# Altium project ESP32IOTProduct.PrjPcb (part 4 of 6)

## Sheet Controller_Sheet.SchDoc
size A4; DocumentNumber: 3; SheetNumber: 3; SheetTotal: 10
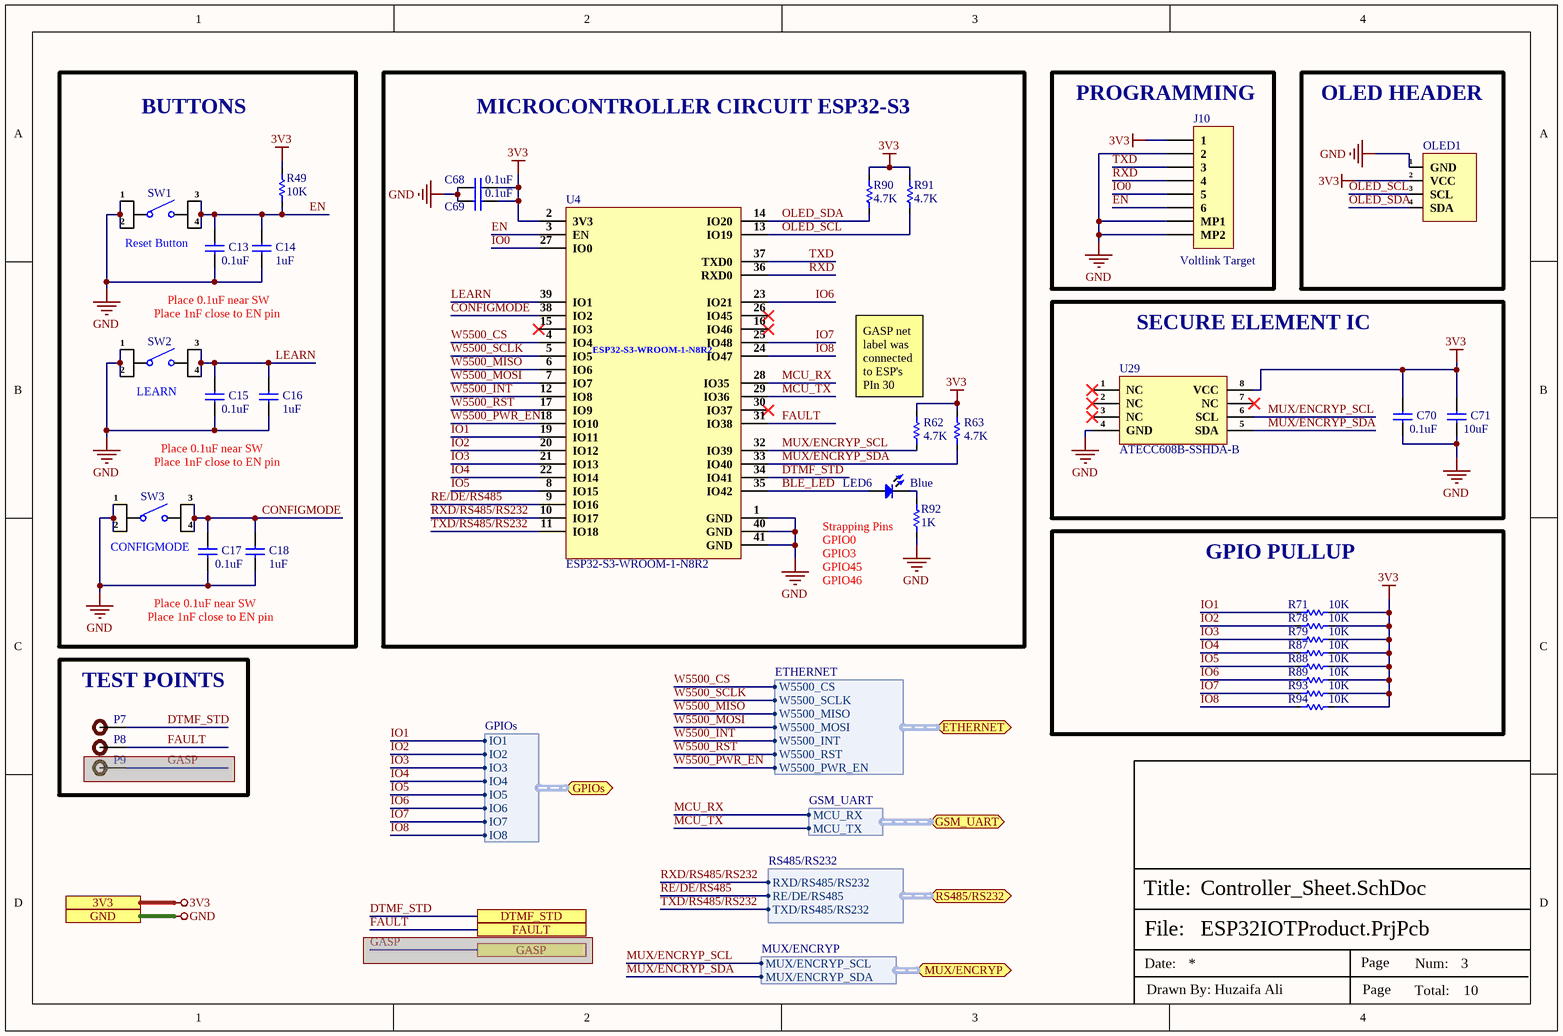
[diagram p5: Controller_Sheet.SchDoc]

### Parts
C13  0.1uF  [Cap-0603]
C14  1uF  [Cap-0603]
C15  0.1uF  [Cap-0603]
C16  1uF  [Cap-0603]
C17  0.1uF  [Cap-0603]
C18  1uF  [Cap-0603]
C68  0.1uF  [Cap-0603]
C69  0.1uF  [Cap-0603]
C70  0.1uF  [Cap-0603]
C71  10uF  [Cap-0603]
J10  Voltlink Target  [Voltlink Target]
LED6  Blue  [LED-0603]
OLED1  OLED 0.96" inch i2C  [OLED 0.96" inch i2C]  (value not drawn)
P7  TEST POINT  [Test-point]  (value not drawn)
P8  TEST POINT  [Test-point]  (value not drawn)
P9  TEST POINT  [Test-point]  (value not drawn)  (masked out: inside a compile mask, not in the netlist)
R49  10K  [Res-0603]
R62  4.7K  [Res-0603]
R63  4.7K  [Res-0603]
R71  10K  [Res-0603]
R78  10K  [Res-0603]
R79  10K  [Res-0603]
R87  10K  [Res-0603]
R88  10K  [Res-0603]
R89  10K  [Res-0603]
R90  4.7K  [Res-0603]
R91  4.7K  [Res-0603]
R92  1K  [Res-0603]
R93  10K  [Res-0603]
R94  10K  [Res-0603]
SW1  K2-6639SP-C4SC-04  [K2-6639SP-C4SC-04]  (value not drawn)
SW2  K2-6639SP-C4SC-04  [K2-6639SP-C4SC-04]  (value not drawn)
SW3  K2-6639SP-C4SC-04  [K2-6639SP-C4SC-04]  (value not drawn)
U4  ESP32-S3-WROOM-1-N8R2  [41-SMD Module]
U29  ATECC608B-SSHDA-B  [SOIC-8]

### Blocks framed on the sheet
BUTTONS: C13-C18 R49 SW1-SW3
MICROCONTROLLER CIRCUIT ESP32-S3: C68 C69 LED6 R62 R63 R90-R92 U4
PROGRAMMING: J10
OLED HEADER: OLED1
SECURE ELEMENT IC: C70 C71 U29
GPIO PULLUP: R71 R78 R79 R87-R89 R93 R94
TEST POINTS: P7-P9

### Ports
3V3, DTMF_STD, ETHERNET (bidir, harness ETHERNET), FAULT, GASP, GND, GPIOs (bidir, harness GPIOs), GSM_UART (bidir, harness GSM_UART), MUX/ENCRYP (bidir, harness MUX/ENCRYP), RS485/RS232 (bidir, harness RS485/RS232)

### Harnesses
ETHERNET: W5500_CS, W5500_SCLK, W5500_MISO, W5500_MOSI, W5500_PWR_EN, W5500_INT, W5500_RST
GSM_UART: MCU_RX, MCU_TX
RS485/RS232: RXD/RS485/RS232, RE/DE/RS485, TXD/RS485/RS232
MUX/ENCRYP: MUX/ENCRYP_SCL, MUX/ENCRYP_SDA
GPIOs: IO1, IO2, IO3, IO4, IO5, IO6, IO7, IO8

### Nets
3V3: C68.1 C69.1 C70.1 C71.1 J10.1 OLED1.2(VCC) R49.2 R62.2 R63.2 R71.1 R78.1 R79.1 R87.1 R88.1 R89.1 R90.2 R91.2 R93.1 R94.1 U4.2(3V3) U29.8(VCC) ; port 3V3
GND: C13.1 C14.2 C15.1 C16.2 C17.1 C18.2 C68.2 C69.2 C70.2 C71.2 J10.2 J10.MP1 J10.MP2 OLED1.1(GND) R92.1 SW1.1 SW1.2 SW2.1 SW2.2 SW3.1 SW3.2 U4.1(GND) U4.40(GND) U4.41(GND) U29.4(GND) ; port GND
BLE_LED: LED6.1 U4.35(IO42)
CONFIGMODE: C17.2 C18.1 SW3.3 SW3.4 U4.38(IO2)
DTMF_STD: P7.1 U4.34(IO41) ; port DTMF_STD
EN: C13.2 C14.1 J10.6 R49.1 SW1.3 SW1.4 U4.3(EN)
FAULT: P8.1 U4.31(IO38) ; port FAULT
IO0: J10.5 U4.27(IO0)
IO1: R71.2 U4.19(IO11) ; port GPIOs.IO1
IO2: R78.2 U4.20(IO12) ; port GPIOs.IO2
IO3: R79.2 U4.21(IO13) ; port GPIOs.IO3
IO4: R87.2 U4.22(IO14) ; port GPIOs.IO4
IO5: R88.2 U4.8(IO15) ; port GPIOs.IO5
IO6: R89.2 U4.23(IO21) ; port GPIOs.IO6
IO7: R93.2 U4.25(IO48) ; port GPIOs.IO7
IO8: R94.2 U4.24(IO47) ; port GPIOs.IO8
LEARN: C15.2 C16.1 SW2.3 SW2.4 U4.39(IO1)
MCU_RX: U4.28(IO35) ; port GSM_UART.MCU_RX
MCU_TX: U4.29(IO36) ; port GSM_UART.MCU_TX
MUX/ENCRYP_SCL: R62.1 U4.32(IO39) U29.6(SCL) ; port MUX/ENCRYP.MUX/ENCRYP_SCL
MUX/ENCRYP_SDA: R63.1 U4.33(IO40) U29.5(SDA) ; port MUX/ENCRYP.MUX/ENCRYP_SDA
OLED_SCL: OLED1.3(SCL) R91.1 U4.13(IO19)
OLED_SDA: OLED1.4(SDA) R90.1 U4.14(IO20)
RE/DE/RS485: U4.9(IO16) ; port RS485/RS232.RE/DE/RS485
RXD: J10.4 U4.36(RXD0)
RXD/RS485/RS232: U4.10(IO17) ; port RS485/RS232.RXD/RS485/RS232
TXD: J10.3 U4.37(TXD0)
TXD/RS485/RS232: U4.11(IO18) ; port RS485/RS232.TXD/RS485/RS232
W5500_CS: U4.4(IO4) ; port ETHERNET.W5500_CS
W5500_INT: U4.12(IO8) ; port ETHERNET.W5500_INT
W5500_MISO: U4.6(IO6) ; port ETHERNET.W5500_MISO
W5500_MOSI: U4.7(IO7) ; port ETHERNET.W5500_MOSI
W5500_PWR_EN: U4.18(IO10) ; port ETHERNET.W5500_PWR_EN
W5500_RST: U4.17(IO9) ; port ETHERNET.W5500_RST
W5500_SCLK: U4.5(IO5) ; port ETHERNET.W5500_SCLK
NetLED6_2: LED6.2 R92.2

Not connected (* = marked no-connect by the designer): U4 15(IO3)* 16(IO46)* 26(IO45)* 30(IO37)*; U29 1(NC)* 2(NC)* 3(NC)* 7(NC)*

### Notes on the sheet
- Reset Button
- Place 0.1uF near SW
- (near SW2) Place 1nF close to EN pin
- LEARN
- (near R62) GASP net label was connected to ESP's PIn 30
- Place 1nF close to EN pin
- CONFIGMODE
- (near R92) Strapping Pins
  GPIO0
  GPIO3
  GPIO45
  GPIO46
- File:
- Title:
- Date:
- Page
- Num:
- Total:
- Drawn By: Huzaifa Ali

### Library data of the parts
C13 C15 C17 C68-C70 = CC0603KRX5R9BB104: CAP CER 0.1UF 50V X5R 0603; Manufacturer: Yageo; Capacitance: 100nF; Tolerance: 10%; Item Type: Capacitor; Supplier 1: Digi-Key; Manufacturer Part Number: CC0603KRX5R9BB104; RoHS: Yes; Category: Ceramic Capacitors; Stock 1: 152253; Pricing 1: 1=0.10000, 10=0.05200, 50=0.02820, 100=0.02310, 500=0.01648, 1000=0.01294 (USD); Mount: Surface Mount; Case/Package: 0603; Case Code (Imperial): 0603; Case Code (Metric): 1608; Weight: 7.1E-05oz; Min Operating Temperature: -55°C; Max Operating Temperature: 85°C; Packaging: Tape and Reel; Voltage Rating: 50V; Dielectric: X5R; Termination: SMD/SMT; Voltage Rating (DC): 50V; Package Quantity: 4000; Length: 0.063inch; Width: 0.031inch; Thickness: 0.035inch; Lead Free: Lead Free; Halogen Free: Halogen Free; ComponentLink1URL: http://www.mouser.com/ds/2/447/Yageo_UPY-GP_NP0_16V-to-50V_9-358835.pdf?src-supplier=Mouser; ComponentLink1Description: http://www.mouser.com/ds/2/447/Yageo_UPY-GP_NP0_16V-to-50V_9-358835.pdf?src-supplier=Mouser; ComponentLink2URL: https://www.yageo.com/upload/media/product/productsearch/datasheet/mlcc/UPY-GPHC_X5R_4V-to-50V_26.pdf?src-supplier=Digi-Key; ComponentLink2Description: https://www.yageo.com/upload/media/product/productsearch/datasheet/mlcc/UPY-GPHC_X5R_4V-to-50V_26.pdf?src-supplier=Digi-Key; ComponentLink3URL: http://www.yageo.com/exep/pages/download/literatures/ProductSelectionGuide%202014_Final_2.pdf?src-supplier=Digi-Key; ComponentLink3Description: http://www.yageo.com/exep/pages/download/literatures/ProductSelectionGuide%202014_Final_2.pdf?src-supplier=Digi-Key; Supplier Part Number 1: 311-4046-1-ND; LCSC Part Number: C110022
C14 C16 C18 = CC0603KRX5R8BB105: CAP CER 1UF 25V X5R 0603; Manufacturer: Yageo; Tolerance: 10%; Supplier 1: Digi-Key; Manufacturer Part Number: CC0603KRX5R8BB105; RoHS: Yes; Category: Ceramic Capacitors; Stock 1: 919939; Pricing 1: 1=0.12000, 10=0.08400, 50=0.04760, 100=0.03940, 500=0.02764, 1000=0.02288 (USD); Mount: Surface Mount; Case/Package: 0603; Number of Pins: 2; Case Code (Metric): 1608; Case Code (Imperial): 0603; Min Operating Temperature: -55°C; Max Operating Temperature: 85°C; Capacitance: 1uF; Dielectric: X5R; Package Quantity: 1; Voltage Rating: 25V; Packaging: Tape and Reel; Termination: SMD/SMT; Voltage Rating (DC): 25V; Series: CC; Construction: Flat; Length: 1.6mm; Width: 0.031inch; Height: 0.8mm; Thickness: 0.035inch; Depth: 0.8mm; Radiation Hardening: No; REACH SVHC: No SVHC; Lead Free: Lead Free; Halogen Free: Halogen Free; RoHS Compliant: Yes; ComponentLink1URL: https://datasheet.ciiva.com/176/mlccorderingcode-176785.pdf?src-supplier=Digi-Key; ComponentLink1Description: https://datasheet.ciiva.com/176/mlccorderingcode-176785.pdf?src-supplier=Digi-Key; ComponentLink2URL: https://datasheet.ciiva.com/176/mlccorderingcode-176786.pdf?src-supplier=Digi-Key; ComponentLink2Description: https://datasheet.ciiva.com/176/mlccorderingcode-176786.pdf?src-supplier=Digi-Key; ComponentLink3URL: https://datasheet.ciiva.com/176/mlccorderingcode-176787.pdf?src-supplier=Digi-Key; ComponentLink3Description: https://datasheet.ciiva.com/176/mlccorderingcode-176787.pdf?src-supplier=Digi-Key; ComponentLink4URL: https://datasheet.ciiva.com/17436/upy-gphc-x5r-4v-to-50v-12-17436952.pdf?src-supplier=Avnet+Europe; ComponentLink4Description: https://datasheet.ciiva.com/17436/upy-gphc-x5r-4v-to-50v-12-17436952.pdf?src-supplier=Avnet+Europe; ComponentLink5URL: https://datasheet.ciiva.com/7978/1525783-7978171.pdf?src-supplier=Element14; ComponentLink5Description: https://datasheet.ciiva.com/7978/1525783-7978171.pdf?src-supplier=Element14; ComponentLink6URL: https://datasheet.ciiva.com/11586/upy-gphc-x5r-4v-to-50v-12-11586318.pdf?src-supplier=Avnet; ComponentLink6Description: https://datasheet.ciiva.com/11586/upy-gphc-x5r-4v-to-50v-12-11586318.pdf?src-supplier=Avnet; Supplier Part Number 1: 311-1445-1-ND; LCSC Part Number: C14664
C71 = C1608X5R1E106M080AC: CAP CER 10UF 25V X5R 0603; Manufacturer: TDK; Dielectric Material: Ceramic; Tolerance: 20%; Supplier 1: Digi-Key; Manufacturer Part Number: C1608X5R1E106M080AC; Stock 1: 61681; Pricing 1: 1=0.96, 10=0.704, 100=0.483, 500=0.38238, 1000=0.322 (USD); Mount: Surface Mount; Case/Package: 0603; Weight: 7.1E-05oz; Case Code (Imperial): 0603; Case Code (Metric): 1608; Min Operating Temperature: -55°C; Max Operating Temperature: 85°C; Capacitance: 10uF; Packaging: Tape and Reel; Voltage Rating: 25V; Voltage Rating (DC): 25V; Termination: SMD/SMT; Package Quantity: 1; Dielectric: X5R; Composition: Ceramic; Length: 1.6mm; Height: 0.8mm; Width: 0.8mm; Thickness: 0.039inch; Depth: 0.8mm; Lead Free: Lead Free; REACH SVHC: No SVHC; Supplier Part Number 1: 445-9015-1-ND; LCSC Part Number: C2168289
J10 = C145963: 1x6P SH 1 1mm 6 SMD,P=1mm Wire To Board / Wire To Wire Connector ROHS; Manufacturer: BOOMELE; Manufacturer Part Number: C145963; Package: SMD,P=1mm; LCSC Part Number: C145963; Item Type: Connector; ComponentLink1Description: LCSC; ComponentLink1URL: https://www.lcsc.com/product-detail/Wire-To-Board-Wire-To-Wire-Connector_BOOMELE-Boom-Precision-Elec-C145963_C145963.html
LED6 = NCD0603B3: blue 0603 Light Emitting Diodes (LED) ROHS; Manufacturer: Foshan NationStar Optoelectronics; Manufacturer Part Number: NCD0603B3; Package: 0603; LCSC Part Number: C158101; Item Type: LED; ComponentLink1Description: LCSC; ComponentLink1URL: https://www.lcsc.com/product-detail/Light-Emitting-Diodes-LED_Foshan-NationStar-Optoelectronics-NCD0603B3_C158101.html
OLED1 = OLED 0.96" inch i2C: 0.96 Inch OLED SSD1306 White/Blue/Yellow 128X64 IIC I2C Serial Display Module 12864 LCD Screen Board For Arduino; Manufacturer: TENSTAR ROBOT; Item Type: OLED Module; Manufacturer Part Number: OLED 0.96" inch i2C; Package: Custom; ComponentLink1Description: Aliexpress; ComponentLink1URL: https://vi.aliexpress.com/item/32643950109.html?gatewayAdapt=glo2vnm
P7-P9 = TEST POINT: Test Point ON
R49 R71 R78 R79 R87-R89 R93 R94 = AC0603JR-0710KL: RES SMD 10K OHM 5% 1/10W 0603; Manufacturer: Yageo; Voltage Rating: 50V; Resistance: 10kR; Power Rating: 100mW; Temperature Coefficient: 100ppm/°C; Item Type: Resistor; Supplier 1: Future Electronics; Manufacturer Part Number: AC0603JR-0710KL; RoHS: Yes; Category: Chip SMD Resistors; Stock 1: 1533000; Pricing 1: 5000=0.00540 (USD); Case/Package: 0603; Case Code (Imperial): 0603; Case Code (Metric): 1608; Size Code: 0603; Min Operating Temperature: -55°C; Max Operating Temperature: 155°C; Packaging: Tape and Reel; Tolerance: 5%; Package Quantity: 1; Resistor Type: Thick Film; Termination: SMD/SMT; Number of Terminations: 2; Max Power Dissipation: 100mW; Features: Moisture Resistant,Automotive AEC-Q200,Anti-Sulfur; Series: AC; Construction: Rectangular; Length: 0.063inch; Width: 0.031inch; Height: 0.022inch; Depth: 0.8mm; Military Standard: Not; Lead Free: Lead Free; RoHS Compliant: Yes; ComponentLink1URL: https://datasheet.ciiva.com/5562/pyu-ac-51-rohs-l-2-5562553.pdf?src-supplier=Mouser; ComponentLink1Description: https://datasheet.ciiva.com/5562/pyu-ac-51-rohs-l-2-5562553.pdf?src-supplier=Mouser; Supplier Part Number 1: 1029044; LCSC Part Number: C140867
R62 R63 R90 R91 = RC0603JR-074K7L: RES SMD 4.7K OHM 5% 1/10W 0603; Manufacturer: Yageo; Resistance: 4.7kR; Temperature Coefficient: 100ppm/°C; Voltage Rating (DC): 50V; Power Rating: 100mW; Item Type: Resistor; Supplier 1: Digi-Key; Manufacturer Part Number: RC0603JR-074K7L; Stock 1: 19706643; Pricing 1: 1=0.1, 10=0.02, 100=0.0081, 1000=0.00362, 2500=0.00314 (USD); Case/Package: 0603; Number of Pins: 2; Case Code (Imperial): 0603; Case Code (Metric): 1608; Min Operating Temperature: -55°C; Max Operating Temperature: 155°C; Tolerance: 5%; Composition: Thick Film; Packaging: Tape and Reel; Voltage Rating: 50V; Termination: SMD/SMT; Military Standard: Not; Length: 1.6mm; Width: 0.8mm; Depth: 0.8mm; REACH SVHC: No SVHC; Lead Free: Lead Free; ComponentLink1URL: http://www.farnell.com/datasheets/443971.pdf?src-supplier=Element14; ComponentLink1Description: http://www.farnell.com/datasheets/443971.pdf?src-supplier=Element14; Supplier Part Number 1: 311-4.7KGRCT-ND; LCSC Part Number: C105428
R92 = RC0603FR-071KL: RES SMD 1K OHM 1% 1/10W 0603; Manufacturer: Yageo; Resistance: 1kR; Temperature Coefficient: 100ppm/°C; Power Rating: 100mW; Voltage Rating: 50V; Item type: Resistor; ComponentLink1URL: https://www.verical.com/server-webapp/html/getDatasheet?partID=409289&src-supplier=Verical; ComponentLink1Description: https://www.verical.com/server-webapp/html/getDatasheet?partID=409289&src-supplier=Verical; Supplier 1: Digi-Key; Manufacturer Part Number: RC0603FR-071KL; Stock 1: 21472395; Pricing 1: 1=0.1, 10=0.023, 100=0.0094, 1000=0.0042, 2500=0.0037 (USD); Case/Package: 0603; Contact Plating: Tin,Matte; Case Code (Imperial): 0603; Case Code (Metric): 1608; Min Operating Temperature: -55°C; Max Operating Temperature: 155°C; Tolerance: 1%; Composition: Thick Film; Packaging: Tape and Reel; Termination: SMD/SMT; Military Standard: Not; Length: 1.6mm; Height: 0.45mm; Depth: 0.8mm; Radiation Hardening: No; REACH SVHC: No SVHC; Lead Free: Lead Free; ComponentLink2URL: http://documents.rs-components.com/techlib://itc_doclist_GB.htm?stockno=5048928&src-supplier=RSComponents; ComponentLink2Description: http://documents.rs-components.com/techlib://itc_doclist_GB.htm?stockno=5048928&src-supplier=RSComponents; ComponentLink3URL: http://www.yageo.com/documents/recent/PYu-RC0603_51_RoHS_L_4.pdf?src-supplier=Avnet+Europe; ComponentLink3Description: http://www.yageo.com/documents/recent/PYu-RC0603_51_RoHS_L_4.pdf?src-supplier=Avnet+Europe; ComponentLink4URL: http://www.farnell.com/datasheets/2167052.pdf?src-supplier=Element14; ComponentLink4Description: http://www.farnell.com/datasheets/2167052.pdf?src-supplier=Element14; ComponentLink5URL: http://www.farnell.com/datasheets/1868787.pdf?src-supplier=Element14; ComponentLink5Description: http://www.farnell.com/datasheets/1868787.pdf?src-supplier=Element14; ComponentLink6URL: http://www.yageo.com/documents/recent/PYu-RC_Group_51_RoHS_L_2.pdf?src-supplier=Avnet; ComponentLink6Description: http://www.yageo.com/documents/recent/PYu-RC_Group_51_RoHS_L_2.pdf?src-supplier=Avnet; ComponentLink7URL: https://www.verical.com/server-webapp/html/getDatasheet?partID=404327&src-supplier=Verical; ComponentLink7Description: https://www.verical.com/server-webapp/html/getDatasheet?partID=404327&src-supplier=Verical; ComponentLink8URL: http://www.farnell.com/datasheets/443971.pdf?src-supplier=Element14; ComponentLink8Description: http://www.farnell.com/datasheets/443971.pdf?src-supplier=Element14; Supplier Part Number 1: 311-1.00KHRDKR-ND; LCSC Part Number: C22548
SW1-SW3 = K2-6639SP-C4SC-04: 50mA Brick nogging SPST 100MΩ 1000000 times 250gf@±30gf 12V SMD Tactile Switches ROHS; Manufacturer: Korean Hroparts Elec; Manufacturer Part Number: K2-6639SP-C4SC-04; LCSC Part Number: C83206; Package: SMD; Item Type: Tactile Switch; ComponentLink1Description: LCSC; ComponentLink1URL: https://www.lcsc.com/product-detail/Tactile-Switches_Korean-Hroparts-Elec-K2-6639SP-C4SC-04_C83206.html
U4 = ESP32-S3-WROOM-1-N8R2: SMD,18x25.5mm WiFi Modules ROHS; Manufacturer: Espressif Systems; Item Type: Module; Supplier 1: Digi-Key; Manufacturer Part Number: ESP32-S3-WROOM-1-N8R2; RoHS: No; Category: Uncategorized; Supplier Part Number 1: 1965-ESP32-S3-WROOM-1-N8R2-ND; ComponentLink1Description: LCSC; ComponentLink1URL: https://www.lcsc.com/product-detail/WiFi-Modules_Espressif-Systems-ESP32-S3-WROOM-1-N8R2_C2913204.html; LCSC Part Number: C2913204
U29 = ATECC608B-SSHDA-B: IC AUTHENTICATION CHIP 8SOIC; Manufacturer: Microchip; Supplier 1: Rs; Manufacturer Part Number: ATECC608B-SSHDA-B; RoHS: Yes; Category: Interface ICs; Stock 1: 590; Pricing 1: 20=0.758, 50=0.704, 80=0.691 (GBP); Supplier Part Number 1: 2368834P; ComponentLink1Description: LCSC; ComponentLink1URL: https://www.lcsc.com/product-detail/Security-Verification-Encryption-ICs_Microchip-Tech-ATECC608B-SSHDA-B_C5444784.html; LCSC Part Number: C5444784; Item Type: IC

## Sheet RS485_RS232_Sheet.SchDoc
size A4; DocumentNumber: 6; SheetNumber: 6; SheetTotal: 10
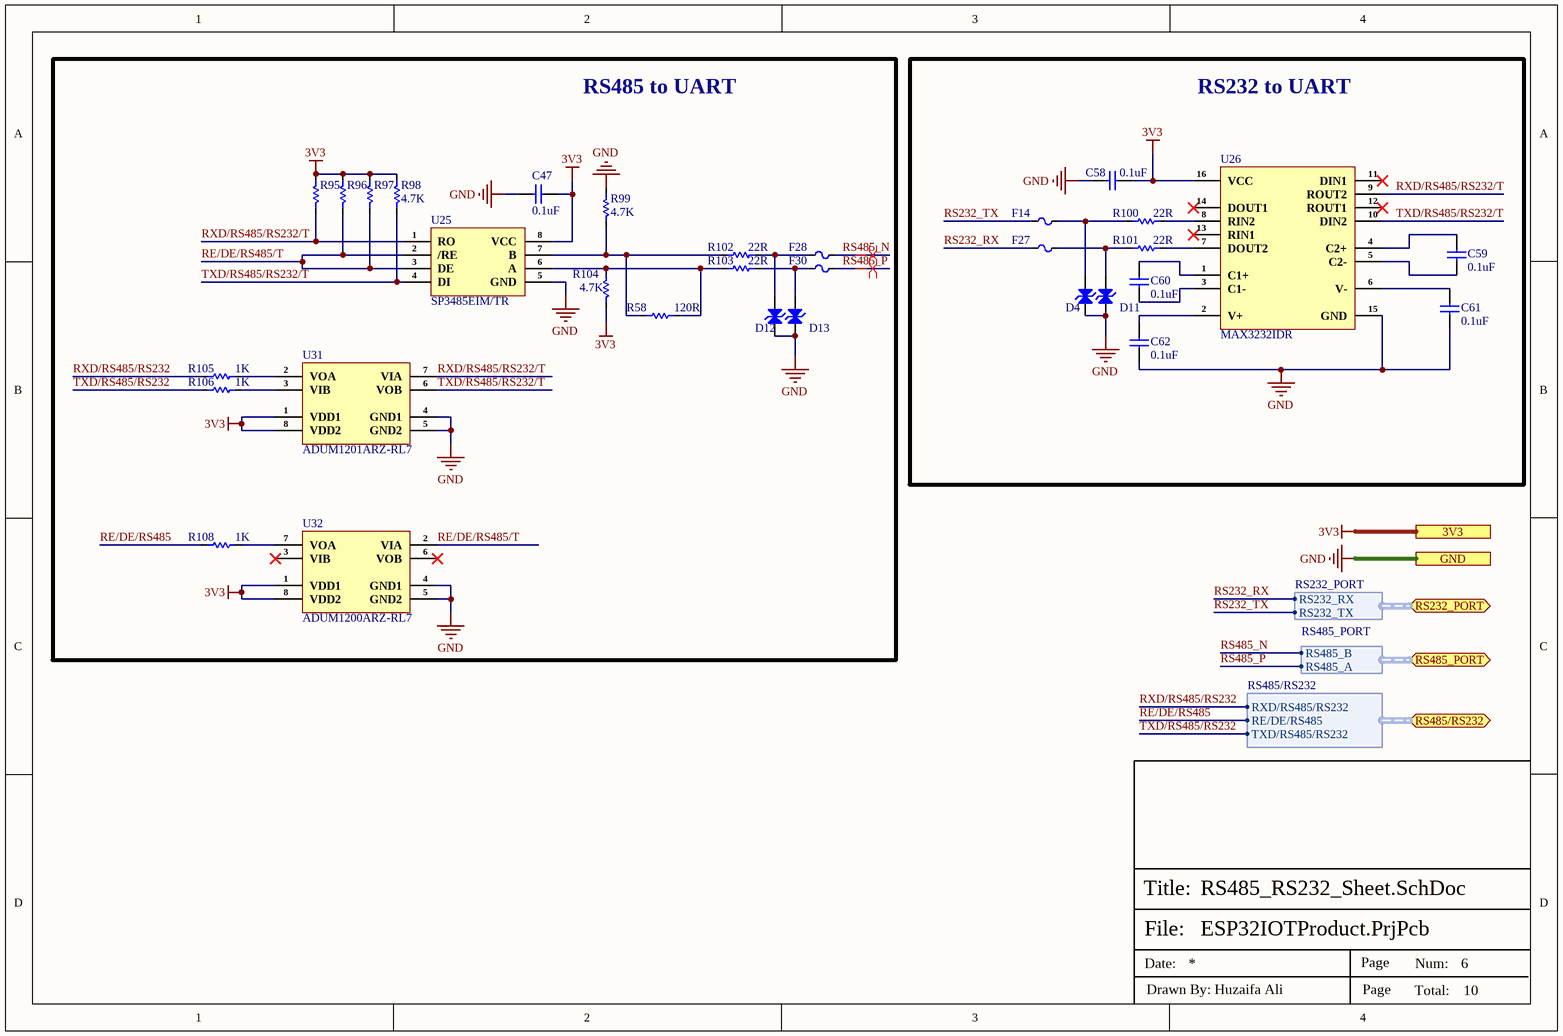
[diagram p6: RS485_RS232_Sheet.SchDoc]

### Parts
C47  0.1uF  [Cap-0603]
C58  0.1uF  [Cap-0603]
C59  0.1uF  [Cap-0603]
C60  0.1uF  [Cap-0603]
C61  0.1uF  [Cap-0603]
C62  0.1uF  [Cap-0603]
D4  SMBJ26CA  [SMB_]  (value not drawn)
D11  SMBJ26CA  [SMB_]  (value not drawn)
D12  SMBJ26CA  [SMB_]  (value not drawn)
D13  SMBJ26CA  [SMB_]  (value not drawn)
F14  SMD0805P020TF  [Fuse-0805]  (value not drawn)
F27  SMD0805P020TF  [Fuse-0805]  (value not drawn)
F28  SMD0805P020TF  [Fuse-0805]  (value not drawn)
F30  SMD0805P020TF  [Fuse-0805]  (value not drawn)
R58  120R  [Res-0603]
R95  4.7K  [Res-0603]  (value not drawn)
R96  4.7K  [Res-0603]  (value not drawn)
R97  4.7K  [Res-0603]  (value not drawn)
R98  4.7K  [Res-0603]
R99  4.7K  [Res-0603]
R100  22R  [Res-0603]
R101  22R  [Res-0603]
R102  22R  [Res-0603]
R103  22R  [Res-0603]
R104  4.7K  [Res-0603]
R105  1K  [Res-0603]
R106  1K  [Res-0603]
R108  1K  [Res-0603]
U25  SP3485EIM/TR  [SOP-8]
U26  MAX3232IDR  [SOIC-16]
U31  ADUM1201ARZ-RL7  [SOIC-8]
U32  ADUM1200ARZ-RL7  [SOIC-8]

### Blocks framed on the sheet
RS485 to UART: C47 D12 D13 F28 F30 R58 R95-R99 R102-R106 R108 U25 U31 U32
RS232 to UART: C58-C62 D4 D11 F14 F27 R100 R101 U26

### Ports
3V3, GND, RS232_PORT (bidir, harness RS232_PORT), RS485/RS232 (bidir, harness RS485/RS232), RS485_PORT (bidir, harness RS485_PORT)

### Harnesses
RS485_PORT: RS485_B, RS485_A
RS232_PORT: RS232_RX, RS232_TX
RS485/RS232: RXD/RS485/RS232, RE/DE/RS485, TXD/RS485/RS232

### Nets
3V3: C47.2 C58.2 R95.1 R96.1 R97.1 R98.1 R104.2 U25.8(VCC) U26.16(VCC) U31.1(VDD1) U31.8(VDD2) U32.1(VDD1) U32.8(VDD2) ; port 3V3
GND: C47.1 C58.1 C61.2 C62.2 D4.1(A) D11.1(A) D12.1(A) D13.1(A) R99.1 U25.5(GND) U26.15(GND) U31.4(GND1) U31.5(GND2) U32.4(GND1) U32.5(GND2) ; port GND
RE/DE/RS485: R108.2 ; port RS485/RS232.RE/DE/RS485
RE/DE/RS485/T: R96.2 R97.2 U25.2(/RE) U25.3(DE) U32.2(VIA)
RS232_RX: F27.1 ; port RS232_PORT.RS232_RX  [project net RS232_PORT.RS232_RX]
RS232_TX: F14.1 ; port RS232_PORT.RS232_TX  [project net RS232_PORT.RS232_TX]
RS485_N: F28.2 ; port RS485_PORT.RS485_B
RS485_P: F30.2 ; port RS485_PORT.RS485_A
RXD/RS485/RS232: R105.2 ; port RS485/RS232.RXD/RS485/RS232
RXD/RS485/RS232/T: R95.2 U25.1(RO) U26.9(ROUT2) U31.7(VIA)
TXD/RS485/RS232: R106.2 ; port RS485/RS232.TXD/RS485/RS232
TXD/RS485/RS232/T: R98.2 U25.4(DI) U26.10(DIN2) U31.6(VOB)
NetC59_1: C59.1 U26.4(C2+)
NetC59_2: C59.2 U26.5(C2-)
NetC60_1: C60.1 U26.1(C1+)
NetC60_2: C60.2 U26.3(C1-)
NetC61_1: C61.1 U26.6(V-)
NetC62_1: C62.1 U26.2(V+)
NetD4_2: D4.2(K) F14.2 R100.1
NetD11_2: D11.2(K) F27.2 R101.1
NetD12_2: D12.2(K) F28.1 R102.2
NetD13_2: D13.2(K) F30.1 R103.2
NetR58_1: R58.1 R99.2 R102.1 U25.7(B)
NetR58_2: R58.2 R103.1 R104.1 U25.6(A)
NetR100_2: R100.2 U26.8(RIN2)
NetR101_2: R101.2 U26.7(DOUT2)
NetR105_1: R105.1 U31.2(VOA)
NetR106_1: R106.1 U31.3(VIB)
NetR108_1: R108.1 U32.7(VOA)

Not connected (* = marked no-connect by the designer): U26 11(DIN1)* 12(ROUT1)* 13(RIN1)* 14(DOUT1)*; U32 3(VIB)* 6(VOB)*

### Layout directives
differential pair; net class RS485; differential pair class RS485_LINES; rule Impedance Constraint [Min = 115.0    Max = 120.0    ]; rule Matched Net Lengths [Tolerance = 0.508mm]: RS485_N, RS485_P

### Notes on the sheet
- File:
- Title:
- Date:
- Page
- Num:
- Total:
- Drawn By: Huzaifa Ali

### Library data of the parts
C47 C58-C62 = CC0603KRX5R9BB104: as C13 on sheet Controller_Sheet; Supplier 1: Digi-Key; Manufacturer Part Number: CC0603KRX5R9BB104; RoHS: Yes; Category: Ceramic Capacitors; Stock 1: 152253; Pricing 1: 1=0.10000, 10=0.05200, 50=0.02820, 100=0.02310, 500=0.01648, 1000=0.01294 (USD); Mount: Surface Mount; Case/Package: 0603; Case Code (Imperial): 0603; Case Code (Metric): 1608; Weight: 7.1E-05oz; Min Operating Temperature: -55°C; Max Operating Temperature: 85°C; Packaging: Tape and Reel; Voltage Rating: 50V; Dielectric: X5R; Termination: SMD/SMT; Voltage Rating (DC): 50V; Package Quantity: 4000; Length: 0.063inch; Width: 0.031inch; Thickness: 0.035inch; Lead Free: Lead Free; Halogen Free: Halogen Free; ComponentLink1URL: http://www.mouser.com/ds/2/447/Yageo_UPY-GP_NP0_16V-to-50V_9-358835.pdf?src-supplier=Mouser; ComponentLink1Description: http://www.mouser.com/ds/2/447/Yageo_UPY-GP_NP0_16V-to-50V_9-358835.pdf?src-supplier=Mouser; ComponentLink2URL: https://www.yageo.com/upload/media/product/productsearch/datasheet/mlcc/UPY-GPHC_X5R_4V-to-50V_26.pdf?src-supplier=Digi-Key; ComponentLink2Description: https://www.yageo.com/upload/media/product/productsearch/datasheet/mlcc/UPY-GPHC_X5R_4V-to-50V_26.pdf?src-supplier=Digi-Key; ComponentLink3URL: http://www.yageo.com/exep/pages/download/literatures/ProductSelectionGuide%202014_Final_2.pdf?src-supplier=Digi-Key; ComponentLink3Description: http://www.yageo.com/exep/pages/download/literatures/ProductSelectionGuide%202014_Final_2.pdf?src-supplier=Digi-Key; Supplier Part Number 1: 311-4046-1-ND; LCSC Part Number: C110022
D4 D11-D13 = SMBJ26CA: SMB(DO-214AA) TVS ROHS; Manufacturer: MSKSEMI; Item Type: Diode; Manufacturer Part Number: SMBJ26CA; Package: SMB(DO-214AA); LCSC Part Number: C5331111; ComponentLink1Description: LCSC; ComponentLink1URL: https://www.lcsc.com/product-detail/TVS_MSKSEMI-SMBJ26CA_C5331111.html
F14 F27 F28 F30 = SMD0805P020TF: 9V 200mA 100A 500mA 0805 Resettable Fuses ROHS; Manufacturer: RUILON; Item Type: Fuse; Manufacturer Part Number: SMD0805P020TF; Package: 0805; LCSC Part Number: C20976; ComponentLink1Description: LCSC; ComponentLink1URL: https://www.lcsc.com/product-detail/Resettable-Fuses_RUILON-Shenzhen-Ruilongyuan-Elec-SMD0805P020TF_C20976.html
R58 = RC0603FR-07120RL: RES 120 OHM 1% 1/10W 0603; Manufacturer: Yageo; Temperature Coefficient: 100ppm/°C; Voltage Rating (DC): 50V; Power Rating: 100mW; Supplier 1: Digi-Key; Manufacturer Part Number: RC0603FR-07120RL; RoHS: Yes; Category: Chip SMD Resistors; Stock 1: 839061; Pricing 1: 1=0.10000, 10=0.02400, 100=0.00970, 1000=0.00436, 2500=0.00378 (USD); Case/Package: 0603; Number of Pins: 2; Case Code (Metric): 1608; Case Code (Imperial): 0603; Size Code: 0603; Min Operating Temperature: -55°C; Max Operating Temperature: 155°C; Resistance: 120R; Tolerance: 1%; Resistor Type: Thick Film; Packaging: Tape and Reel; Voltage Rating: 50V; Package Quantity: 1; Number of Terminations: 2; Termination: SMD/SMT; Max Power Dissipation: 100mW; Features: Moisture Resistant; Series: RC; Construction: Rectangular; Resistance Tolerance: 1%; Length: 1.6mm; Width: 0.031inch; Height: 0.022inch; Depth: 0.8mm; REACH SVHC: No SVHC; Lead Free: Lead Free; Military Standard: Not; RoHS Compliant: Yes; ComponentLink1URL: https://datasheet.ciiva.com/2553/pyu-r-int-thick-7-2553512.pdf?src-supplier=Digi-Key; ComponentLink1Description: https://datasheet.ciiva.com/2553/pyu-r-int-thick-7-2553512.pdf?src-supplier=Digi-Key; ComponentLink2URL: https://datasheet.ciiva.com/7746/443971-7746248.pdf?src-supplier=Element14; ComponentLink2Description: https://datasheet.ciiva.com/7746/443971-7746248.pdf?src-supplier=Element14; ComponentLink3URL: https://datasheet.ciiva.com/2553/pyu-r-int-thick-7-2553513.pdf?src-supplier=Digi-Key; ComponentLink3Description: https://datasheet.ciiva.com/2553/pyu-r-int-thick-7-2553513.pdf?src-supplier=Digi-Key; ComponentLink4URL: https://datasheet.ciiva.com/7746/443971-7746249.pdf?src-supplier=Element14; ComponentLink4Description: https://datasheet.ciiva.com/7746/443971-7746249.pdf?src-supplier=Element14; ComponentLink5URL: https://datasheet.ciiva.com/2553/pyu-r-int-thick-7-2553514.pdf?src-supplier=Digi-Key; ComponentLink5Description: https://datasheet.ciiva.com/2553/pyu-r-int-thick-7-2553514.pdf?src-supplier=Digi-Key; ComponentLink6URL: https://datasheet.ciiva.com/46395/443971-46395021.pdf?src-supplier=Element14; ComponentLink6Description: https://datasheet.ciiva.com/46395/443971-46395021.pdf?src-supplier=Element14; Supplier Part Number 1: 311-120HRCT-ND; LCSC Part Number: C114640
R95-R99 R104 = RC0603JR-074K7L: as R62 on sheet Controller_Sheet; Supplier 1: Digi-Key; Manufacturer Part Number: RC0603JR-074K7L; Stock 1: 19706643; Pricing 1: 1=0.1, 10=0.02, 100=0.0081, 1000=0.00362, 2500=0.00314 (USD); Case/Package: 0603; Number of Pins: 2; Case Code (Imperial): 0603; Case Code (Metric): 1608; Min Operating Temperature: -55°C; Max Operating Temperature: 155°C; Tolerance: 5%; Composition: Thick Film; Packaging: Tape and Reel; Voltage Rating: 50V; Termination: SMD/SMT; Military Standard: Not; Length: 1.6mm; Width: 0.8mm; Depth: 0.8mm; REACH SVHC: No SVHC; Lead Free: Lead Free; ComponentLink1URL: http://www.farnell.com/datasheets/443971.pdf?src-supplier=Element14; ComponentLink1Description: http://www.farnell.com/datasheets/443971.pdf?src-supplier=Element14; Supplier Part Number 1: 311-4.7KGRCT-ND; LCSC Part Number: C105428
R100-R103 = RC0603FR-0722RL: RES 22 OHM 1% 1/10W 0603; Manufacturer: Yageo; Temperature Coefficient: 100ppm/°C; Voltage Rating (DC): 50V; Power Rating: 100mW; Item Type: Resistor; Supplier 1: Avnet; Manufacturer Part Number: RC0603FR-0722RL; RoHS: Yes; Category: Chip SMD Resistors; Stock 1: 190000; Pricing 1: 5000=0.00133, 10000=0.00131, 20000=0.00127 (USD); Case/Package: 0603; Number of Pins: 2; Case Code (Metric): 1608; Case Code (Imperial): 0603; Size Code: 0603; Min Operating Temperature: -55°C; Max Operating Temperature: 155°C; Tolerance: 1%; Resistance: 22R; Resistor Type: Thick Film; Packaging: Tape and Reel; Voltage Rating: 50V; Package Quantity: 1; Number of Terminations: 2; Termination: SMD/SMT; Max Power Dissipation: 100mW; Features: Moisture Resistant; Series: RC; Resistance Tolerance: 1%; Technology: THICK FILM; Construction: Rectangular; Length: 0.063inch; Width: 0.031inch; Height: 0.022inch; Depth: 0.8mm; Reach SVHC Compliant: Yes; Lead Free: Lead Free; Military Standard: Not; RoHS Compliant: Yes; ComponentLink1URL: https://datasheet.ciiva.com/11819/0900766b80f96399-11819285.pdf?src-supplier=RSComponents; ComponentLink1Description: https://datasheet.ciiva.com/11819/0900766b80f96399-11819285.pdf?src-supplier=RSComponents; ComponentLink2URL: https://datasheet.ciiva.com/46395/443971-46395032.pdf?src-supplier=Element14; ComponentLink2Description: https://datasheet.ciiva.com/46395/443971-46395032.pdf?src-supplier=Element14; ComponentLink3URL: https://datasheet.ciiva.com/46440/1868787-46440901.pdf?src-supplier=Element14; ComponentLink3Description: https://datasheet.ciiva.com/46440/1868787-46440901.pdf?src-supplier=Element14; ComponentLink4URL: https://datasheet.ciiva.com/2454/pyu-r-int-thick-7-2454355.pdf?src-supplier=Digi-Key; ComponentLink4Description: https://datasheet.ciiva.com/2454/pyu-r-int-thick-7-2454355.pdf?src-supplier=Digi-Key; ComponentLink5URL: https://datasheet.ciiva.com/2454/pyu-r-int-thick-7-2454356.pdf?src-supplier=Digi-Key; ComponentLink5Description: https://datasheet.ciiva.com/2454/pyu-r-int-thick-7-2454356.pdf?src-supplier=Digi-Key; ComponentLink6URL: https://datasheet.ciiva.com/2454/pyu-r-int-thick-7-2454354.pdf?src-supplier=Digi-Key; ComponentLink6Description: https://datasheet.ciiva.com/2454/pyu-r-int-thick-7-2454354.pdf?src-supplier=Digi-Key; Supplier Part Number 1: RC0603FR-0722RL; LCSC Part Number: C107701
R105 R106 R108 = RC0603FR-071KL: as R92 on sheet Controller_Sheet; ComponentLink1URL: https://www.verical.com/server-webapp/html/getDatasheet?partID=409289&src-supplier=Verical; ComponentLink1Description: https://www.verical.com/server-webapp/html/getDatasheet?partID=409289&src-supplier=Verical; Supplier 1: Digi-Key; Manufacturer Part Number: RC0603FR-071KL; Stock 1: 21472395; Pricing 1: 1=0.1, 10=0.023, 100=0.0094, 1000=0.0042, 2500=0.0037 (USD); Case/Package: 0603; Contact Plating: Tin,Matte; Case Code (Imperial): 0603; Case Code (Metric): 1608; Min Operating Temperature: -55°C; Max Operating Temperature: 155°C; Tolerance: 1%; Composition: Thick Film; Packaging: Tape and Reel; Termination: SMD/SMT; Military Standard: Not; Length: 1.6mm; Height: 0.45mm; Depth: 0.8mm; Radiation Hardening: No; REACH SVHC: No SVHC; Lead Free: Lead Free; ComponentLink2URL: http://documents.rs-components.com/techlib://itc_doclist_GB.htm?stockno=5048928&src-supplier=RSComponents; ComponentLink2Description: http://documents.rs-components.com/techlib://itc_doclist_GB.htm?stockno=5048928&src-supplier=RSComponents; ComponentLink3URL: http://www.yageo.com/documents/recent/PYu-RC0603_51_RoHS_L_4.pdf?src-supplier=Avnet+Europe; ComponentLink3Description: http://www.yageo.com/documents/recent/PYu-RC0603_51_RoHS_L_4.pdf?src-supplier=Avnet+Europe; ComponentLink4URL: http://www.farnell.com/datasheets/2167052.pdf?src-supplier=Element14; ComponentLink4Description: http://www.farnell.com/datasheets/2167052.pdf?src-supplier=Element14; ComponentLink5URL: http://www.farnell.com/datasheets/1868787.pdf?src-supplier=Element14; ComponentLink5Description: http://www.farnell.com/datasheets/1868787.pdf?src-supplier=Element14; ComponentLink6URL: http://www.yageo.com/documents/recent/PYu-RC_Group_51_RoHS_L_2.pdf?src-supplier=Avnet; ComponentLink6Description: http://www.yageo.com/documents/recent/PYu-RC_Group_51_RoHS_L_2.pdf?src-supplier=Avnet; ComponentLink7URL: https://www.verical.com/server-webapp/html/getDatasheet?partID=404327&src-supplier=Verical; ComponentLink7Description: https://www.verical.com/server-webapp/html/getDatasheet?partID=404327&src-supplier=Verical; ComponentLink8URL: http://www.farnell.com/datasheets/443971.pdf?src-supplier=Element14; ComponentLink8Description: http://www.farnell.com/datasheets/443971.pdf?src-supplier=Element14; Supplier Part Number 1: 311-1.00KHRDKR-ND; LCSC Part Number: C22548
U25 = SP3485EIM/TR: SOP-8 RS-485/RS-422 ICs ROHS; Manufacturer: HGSEMI; Item Type: IC; Manufacturer Part Number: SP3485EIM/TR; Package: SOP-8; LCSC Part Number: C519086; ComponentLink1Description: LCSC; ComponentLink1URL: https://www.lcsc.com/product-detail/RS-485-RS-422-ICs_HGSEMI-SP3485EIM-TR_C519086.html
U26 = MAX3232IDR: IC TRANSCEIVER FULL 2/2 16SOIC; Manufacturer: Texas Instruments; Min Supply Voltage: 3V; Max Supply Voltage: 5.5V; Data Rate: 250Kbps; Number of Receivers: 2; Operating Supply Voltage: 5V; Logic Function: Transceiver,Receiver; Number of Transceivers: 1; Supply Current: 1mA; Simplex/Duplex: Full Duplex; Receiver Hysteresis: 300mV; Supplier 1: Mouser; Manufacturer Part Number: MAX3232IDR; RoHS: Yes; Category: Interface ICs; Stock 1: 22181; Pricing 1: 1=2.37, 10=2.37, 50=2.37, 100=2.37, 1000=2.37, 10000=2.37 (USD); Mounting Technology: Surface Mount; Case/Package: D; Pins: 16; Weight: 0.004998oz; Min Operating Temperature: -40°C; Max Operating Temperature: 85°C; Packaging: Tape and Reel; Package Quantity: 1; Number of Transmitters: 2; Number of Drivers: 2; Series: -; Operating Supply Current: 1mA; Lead Free: Lead Free; RoHS Compliant: Yes; Reach SVHC Compliant: No; ComponentLink1URL: https://datasheet.ciiva.com/8064/1882754-8064745.pdf?src-supplier=Element14; ComponentLink1Description: https://datasheet.ciiva.com/8064/1882754-8064745.pdf?src-supplier=Element14; ComponentLink2URL: https://datasheet.ciiva.com/46394/1882754-46394523.pdf?src-supplier=Element14; ComponentLink2Description: https://datasheet.ciiva.com/46394/1882754-46394523.pdf?src-supplier=Element14; ComponentLink3URL: https://datasheet.ciiva.com/46397/1882754-46397996.pdf?src-supplier=Element14; ComponentLink3Description: https://datasheet.ciiva.com/46397/1882754-46397996.pdf?src-supplier=Element14; ComponentLink4URL: https://datasheet.ciiva.com/1701/max3232-1701626.pdf?src-supplier=Digi-Key; ComponentLink4Description: https://datasheet.ciiva.com/1701/max3232-1701626.pdf?src-supplier=Digi-Key; ComponentLink5URL: https://datasheet.ciiva.com/1701/max3232-1701625.pdf?src-supplier=Digi-Key; ComponentLink5Description: https://datasheet.ciiva.com/1701/max3232-1701625.pdf?src-supplier=Digi-Key; ComponentLink6URL: https://datasheet.ciiva.com/1701/max3232-1701627.pdf?src-supplier=Digi-Key; ComponentLink6Description: https://datasheet.ciiva.com/1701/max3232-1701627.pdf?src-supplier=Digi-Key; Supplier Part Number 1: 595-MAX3232IDR; LCSC Part Number: C18261; Item Type: IC
U31 = ADUM1201ARZ-RL7: DGTL ISO 2.5KV GEN PURP 8SOIC; Manufacturer: Analog Devices; Number of Channels: 2; Propagation Delay: 150ns; Min Supply Voltage: 2.7V; Max Supply Voltage: 5.5V; Data Rate: 25Mbps; Channel Type: Unidirectional; Polarity: Bidirectional; Operating Supply Current: 600uA; ESD Protection: No; Output Current: 35mA; Pulse Width Distortion (PWD): 40ns; Voltage: 5V; Approvals: UL,CSA,VDE; Item Type: IC; Supplier 1: Arrow Electronics; Manufacturer Part Number: ADUM1201ARZ-RL7; RoHS: Yes; Category: Interface ICs; Stock 1: 710; Pricing 1: 1=3.9521, 10=3.5429, 25=3.3533, 100=2.9042, 250=2.7545, 500=2.475, 1000=2.2037 (USD); Case/Package: R; Pins: 8; Weight: 0.019048oz; Min Operating Temperature: -40°C; Max Operating Temperature: 125°C; Packaging: Tape and Reel; Turn-On Delay Time: 150ns; Isolated Power: No; Type: General Purpose; Max Supply Current: 600uA; Series: iCoupler®; Radiation Hardening: No; Lead Free: Contains Lead; RoHS Compliant: Yes; ComponentLink1URL: https://datasheet.ciiva.com/15119/getdatasheetpartid-121048-15119389.pdf?src-supplier=Verical; ComponentLink1Description: https://datasheet.ciiva.com/15119/getdatasheetpartid-121048-15119389.pdf?src-supplier=Verical; ComponentLink2URL: https://datasheet.ciiva.com/15367/adum1200-1201-279454-15367752.pdf?src-supplier=Mouser; ComponentLink2Description: https://datasheet.ciiva.com/15367/adum1200-1201-279454-15367752.pdf?src-supplier=Mouser; ComponentLink3URL: https://datasheet.ciiva.com/3149/adum1200-1201-3149740.pdf?src-supplier=Avnet; ComponentLink3Description: https://datasheet.ciiva.com/3149/adum1200-1201-3149740.pdf?src-supplier=Avnet; ComponentLink4URL: https://datasheet.ciiva.com/3148/adum1200-1201-3148345.pdf?src-supplier=Avnet; ComponentLink4Description: https://datasheet.ciiva.com/3148/adum1200-1201-3148345.pdf?src-supplier=Avnet; ComponentLink5URL: https://datasheet.ciiva.com/2081/adum1200-1201-2081793.pdf?src-supplier=Digi-Key; ComponentLink5Description: https://datasheet.ciiva.com/2081/adum1200-1201-2081793.pdf?src-supplier=Digi-Key; ComponentLink6URL: https://datasheet.ciiva.com/2081/adum1200-1201-2081794.pdf?src-supplier=Digi-Key; ComponentLink6Description: https://datasheet.ciiva.com/2081/adum1200-1201-2081794.pdf?src-supplier=Digi-Key; ComponentLink7URL: https://datasheet.ciiva.com/2081/adum1200-1201-2081792.pdf?src-supplier=Digi-Key; ComponentLink7Description: https://datasheet.ciiva.com/2081/adum1200-1201-2081792.pdf?src-supplier=Digi-Key; Supplier Part Number 1: ADUM1201ARZ-RL7; LCSC Part Number: C9669
U32 = ADUM1200ARZ-RL7: DGTL ISO 2.5KV GEN PURP 8SOIC; Manufacturer: Analog Devices; Number of Channels: 2; Propagation Delay: 150ns; Min Supply Voltage: 2.7V; Operating Supply Voltage: 3.3V; Max Supply Voltage: 5.5V; Data Rate: 25Mbps; Channel Type: Unidirectional; Output Current: 35mA; Isolated Power: No; Pulse Width Distortion (PWD): 40ns; Supply Current: 600uA; Item Type: IC; Supplier 1: Arrow Electronics; Manufacturer Part Number: ADUM1200ARZ-RL7; RoHS: Yes; Category: Interface ICs; Stock 1: 14777; Pricing 1: 1=3.887, 10=3.493, 25=3.295, 100=2.865, 250=2.706, 500=2.425, 1000=2.066, 3000=2.048, 6000=2.025 (USD); Case/Package: R; Pins: 8; Min Operating Temperature: -40°C; Max Operating Temperature: 125°C; Packaging: Tape and Reel; Package Quantity: 1000; Turn-On Delay Time: 150ns; Type: General Purpose; Series: iCoupler®; Radiation Hardening: No; Lead Free: Contains Lead; RoHS Compliant: Yes; ComponentLink1URL: https://datasheet.ciiva.com/15119/getdatasheetpartid-258305-15119482.pdf?src-supplier=Verical; ComponentLink1Description: https://datasheet.ciiva.com/15119/getdatasheetpartid-258305-15119482.pdf?src-supplier=Verical; ComponentLink2URL: https://datasheet.ciiva.com/30514/1805054-30514023.pdf?src-supplier=Jameco; ComponentLink2Description: https://datasheet.ciiva.com/30514/1805054-30514023.pdf?src-supplier=Jameco; ComponentLink3URL: https://datasheet.ciiva.com/3148/adum1200-1201-3148342.pdf?src-supplier=Avnet; ComponentLink3Description: https://datasheet.ciiva.com/3148/adum1200-1201-3148342.pdf?src-supplier=Avnet; ComponentLink4URL: https://datasheet.ciiva.com/2081/adum1200-1201-2081796.pdf?src-supplier=Digi-Key; ComponentLink4Description: https://datasheet.ciiva.com/2081/adum1200-1201-2081796.pdf?src-supplier=Digi-Key; ComponentLink5URL: https://datasheet.ciiva.com/2081/adum1200-1201-2081797.pdf?src-supplier=Digi-Key; ComponentLink5Description: https://datasheet.ciiva.com/2081/adum1200-1201-2081797.pdf?src-supplier=Digi-Key; ComponentLink6URL: https://datasheet.ciiva.com/2081/adum1200-1201-2081795.pdf?src-supplier=Digi-Key; ComponentLink6Description: https://datasheet.ciiva.com/2081/adum1200-1201-2081795.pdf?src-supplier=Digi-Key; Supplier Part Number 1: ADUM1200ARZ-RL7; LCSC Part Number: C15219

## Sheet LEDs_Sheet.SchDoc
size A4; SheetNumber: 8; SheetTotal: 10
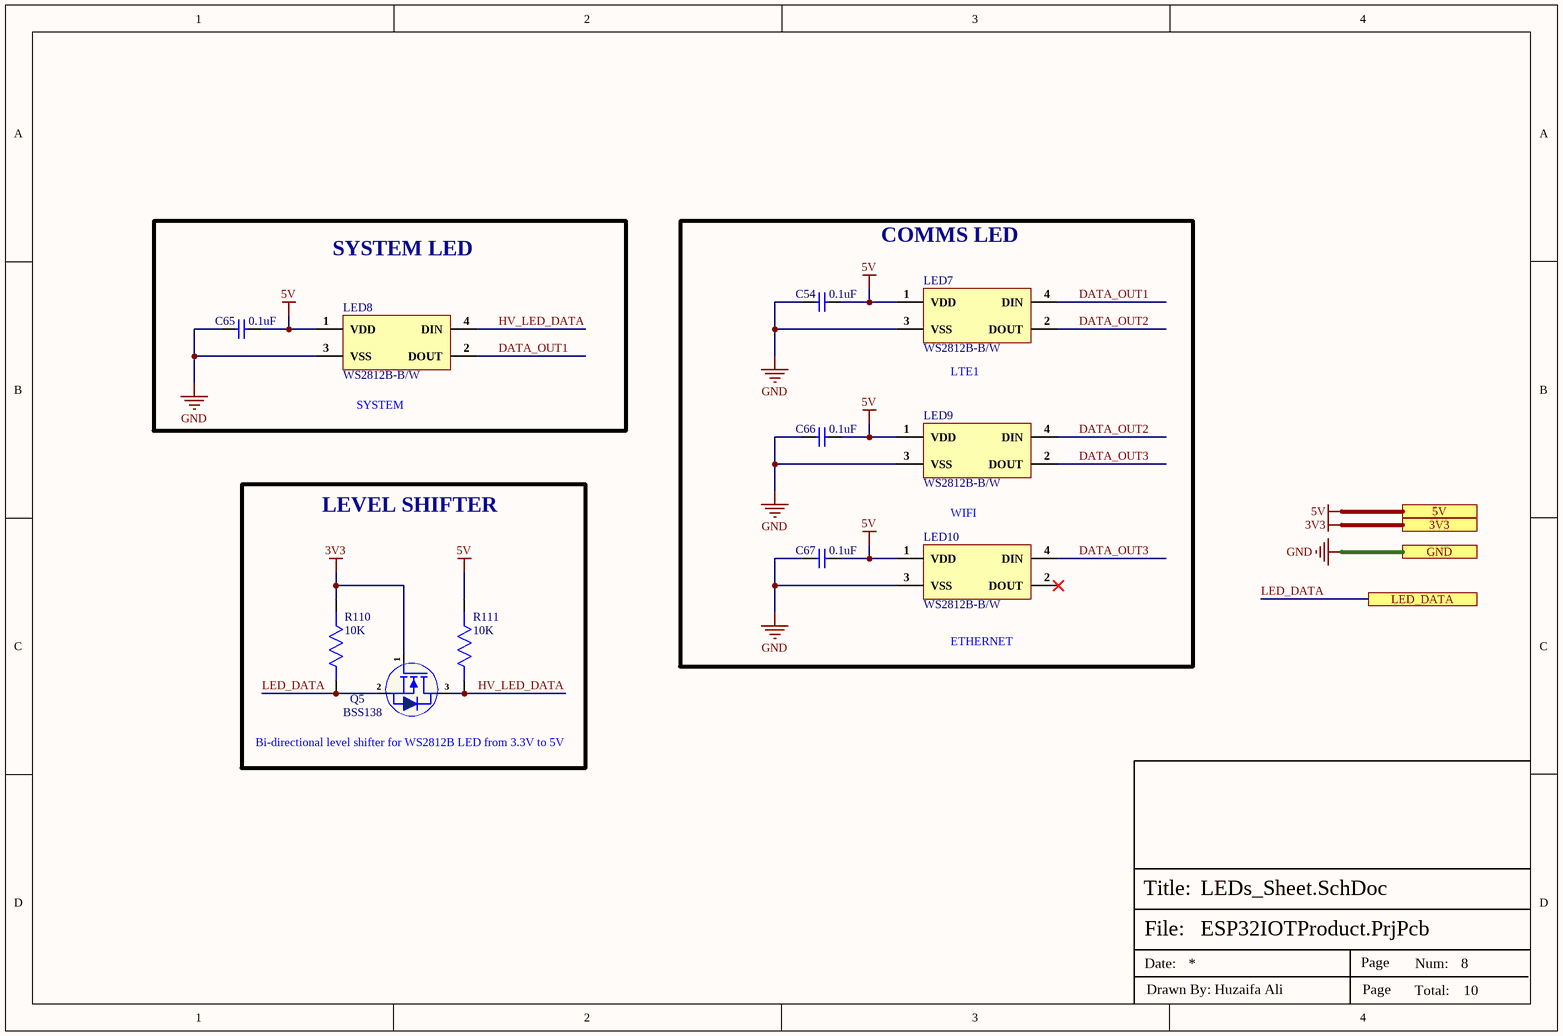
[diagram p7: LEDs_Sheet.SchDoc]

### Parts
C54  0.1uF  [Cap-0603]
C65  0.1uF  [Cap-0603]
C66  0.1uF  [Cap-0603]
C67  0.1uF  [Cap-0603]
LED7  WS2812B-B/W  [WS2812B-B/W]
LED8  WS2812B-B/W  [WS2812B-B/W]
LED9  WS2812B-B/W  [WS2812B-B/W]
LED10  WS2812B-B/W  [WS2812B-B/W]
Q5  BSS138  [Sot-23]
R110  10K  [Res-0603]
R111  10K  [Res-0603]

### Blocks framed on the sheet
SYSTEM LED: C65 LED8
COMMS LED: C54 C66 C67 LED7 LED9 LED10
LEVEL SHIFTER: Q5 R110 R111

### Ports
3V3, 5V, GND, LED_DATA

### Nets
3V3: Q5.1(G) R110.1 ; port 3V3
5V: C54.1 C65.1 C66.1 C67.1 LED7.1(VDD) LED8.1(VDD) LED9.1(VDD) LED10.1(VDD) R111.1 ; port 5V
GND: C54.2 C65.2 C66.2 C67.2 LED7.3(VSS) LED8.3(VSS) LED9.3(VSS) LED10.3(VSS) ; port GND
DATA_OUT1: LED7.4(DIN) LED8.2(DOUT)
DATA_OUT2: LED7.2(DOUT) LED9.4(DIN)
DATA_OUT3: LED9.2(DOUT) LED10.4(DIN)
HV_LED_DATA: LED8.4(DIN) Q5.3(D) R111.2
LED_DATA: Q5.2(S) R110.2 ; port LED_DATA

Not connected (* = marked no-connect by the designer): LED10 2(DOUT)*

### Notes on the sheet
- (near LED7) LTE1
- (near LED8) SYSTEM
- WIFI
- (near LED10) ETHERNET
- Bi-directional level shifter for WS2812B LED from 3.3V to 5V
- File:
- Title:
- Date:
- Page
- Num:
- Total:
- Drawn By: Huzaifa Ali

### Library data of the parts
C54 C65-C67 = CC0603KRX5R9BB104: as C13 on sheet Controller_Sheet; Supplier 1: Digi-Key; Manufacturer Part Number: CC0603KRX5R9BB104; RoHS: Yes; Category: Ceramic Capacitors; Stock 1: 152253; Pricing 1: 1=0.10000, 10=0.05200, 50=0.02820, 100=0.02310, 500=0.01648, 1000=0.01294 (USD); Mount: Surface Mount; Case/Package: 0603; Case Code (Imperial): 0603; Case Code (Metric): 1608; Weight: 7.1E-05oz; Min Operating Temperature: -55°C; Max Operating Temperature: 85°C; Packaging: Tape and Reel; Voltage Rating: 50V; Dielectric: X5R; Termination: SMD/SMT; Voltage Rating (DC): 50V; Package Quantity: 4000; Length: 0.063inch; Width: 0.031inch; Thickness: 0.035inch; Lead Free: Lead Free; Halogen Free: Halogen Free; ComponentLink1URL: http://www.mouser.com/ds/2/447/Yageo_UPY-GP_NP0_16V-to-50V_9-358835.pdf?src-supplier=Mouser; ComponentLink1Description: http://www.mouser.com/ds/2/447/Yageo_UPY-GP_NP0_16V-to-50V_9-358835.pdf?src-supplier=Mouser; ComponentLink2URL: https://www.yageo.com/upload/media/product/productsearch/datasheet/mlcc/UPY-GPHC_X5R_4V-to-50V_26.pdf?src-supplier=Digi-Key; ComponentLink2Description: https://www.yageo.com/upload/media/product/productsearch/datasheet/mlcc/UPY-GPHC_X5R_4V-to-50V_26.pdf?src-supplier=Digi-Key; ComponentLink3URL: http://www.yageo.com/exep/pages/download/literatures/ProductSelectionGuide%202014_Final_2.pdf?src-supplier=Digi-Key; ComponentLink3Description: http://www.yageo.com/exep/pages/download/literatures/ProductSelectionGuide%202014_Final_2.pdf?src-supplier=Digi-Key; Supplier Part Number 1: 311-4046-1-ND; LCSC Part Number: C110022
LED7-LED10 = WS2812B-B/W: RGB SMD5050 Light Emitting Diodes (LED) ROHS; Manufacturer: Worldsemi; Item Type: RGB LED; Manufacturer Part Number: WS2812B-B/W; Package: SMD5050; LCSC Part Number: C114586; ComponentLink1Description: LCSC; ComponentLink1URL: https://www.lcsc.com/product-detail/Light-Emitting-Diodes-LED_Worldsemi-WS2812B-B-W_C114586.html
Q5 = BSS138: 50V 220mA 3.5Ω@10V,220mA 225mW 1.6V@1mA N Channel SOT-23 MOSFETs ROHS; Manufacturer: Slkor(SLKORMICRO Elec.); Item Type: Mosfet; Manufacturer Part Number: BSS138; Package: SOT-23; LCSC Part Number: C426569; ComponentLink1Description: LCSC; ComponentLink1URL: https://www.lcsc.com/product-detail/MOSFETs_Slkor-SLKORMICRO-Elec-BSS138_C426569.html
R110 R111 = AC0603JR-0710KL: as R49 on sheet Controller_Sheet; Supplier 1: Future Electronics; Manufacturer Part Number: AC0603JR-0710KL; RoHS: Yes; Category: Chip SMD Resistors; Stock 1: 1533000; Pricing 1: 5000=0.00540 (USD); Case/Package: 0603; Case Code (Imperial): 0603; Case Code (Metric): 1608; Size Code: 0603; Min Operating Temperature: -55°C; Max Operating Temperature: 155°C; Packaging: Tape and Reel; Tolerance: 5%; Package Quantity: 1; Resistor Type: Thick Film; Termination: SMD/SMT; Number of Terminations: 2; Max Power Dissipation: 100mW; Features: Moisture Resistant,Automotive AEC-Q200,Anti-Sulfur; Series: AC; Construction: Rectangular; Length: 0.063inch; Width: 0.031inch; Height: 0.022inch; Depth: 0.8mm; Military Standard: Not; Lead Free: Lead Free; RoHS Compliant: Yes; ComponentLink1URL: https://datasheet.ciiva.com/5562/pyu-ac-51-rohs-l-2-5562553.pdf?src-supplier=Mouser; ComponentLink1Description: https://datasheet.ciiva.com/5562/pyu-ac-51-rohs-l-2-5562553.pdf?src-supplier=Mouser; Supplier Part Number 1: 1029044; LCSC Part Number: C140867